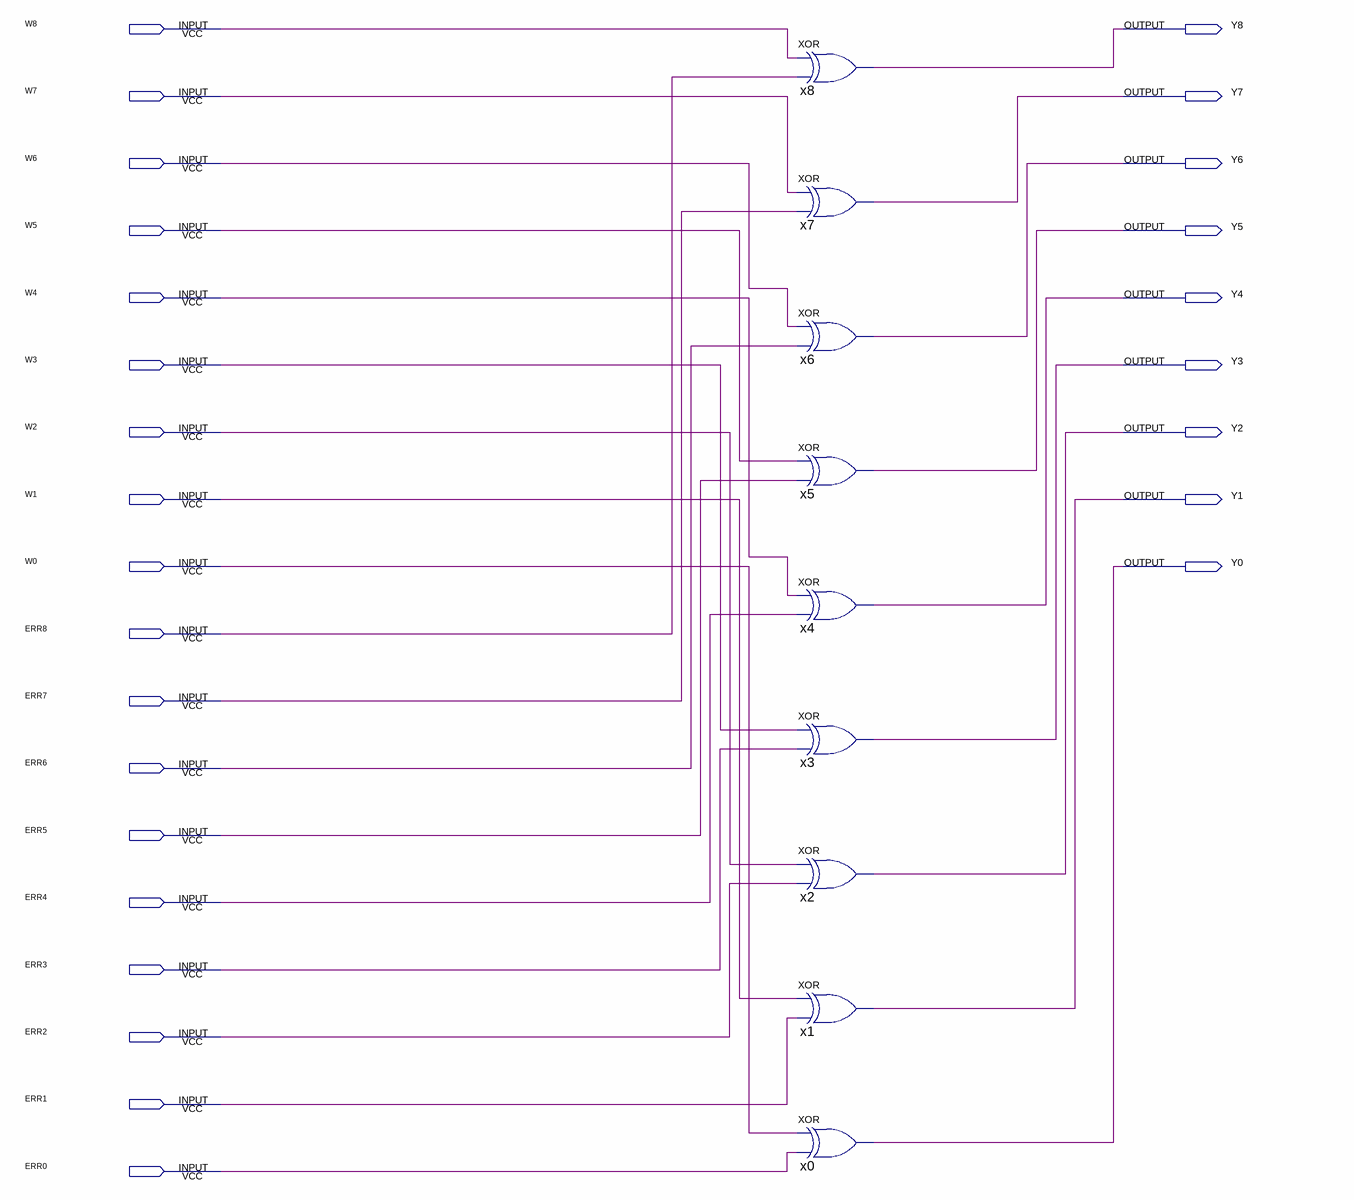
[diagram p0: schematic sheet]
// Quartus schematic dtm.bdf as structural Verilog: 9 symbols, 27 pins
module dtm (
  input  W8,
  input  W7,
  input  W6,
  input  W5,
  input  W4,
  input  W3,
  input  W2,
  input  W1,
  input  W0,
  input  ERR8,
  input  ERR7,
  input  ERR6,
  input  ERR5,
  input  ERR4,
  input  ERR3,
  input  ERR2,
  input  ERR1,
  input  ERR0,
  output Y8,
  output Y7,
  output Y6,
  output Y5,
  output Y4,
  output Y3,
  output Y2,
  output Y1,
  output Y0
);

  xor x8 (Y8, W8, ERR8);
  xor x7 (Y7, W7, ERR7);
  xor x6 (Y6, W6, ERR6);
  xor x5 (Y5, W5, ERR5);
  xor x4 (Y4, W4, ERR4);
  xor x3 (Y3, W3, ERR3);
  xor x2 (Y2, W2, ERR2);
  xor x1 (Y1, W1, ERR1);
  xor x0 (Y0, W0, ERR0);
endmodule
